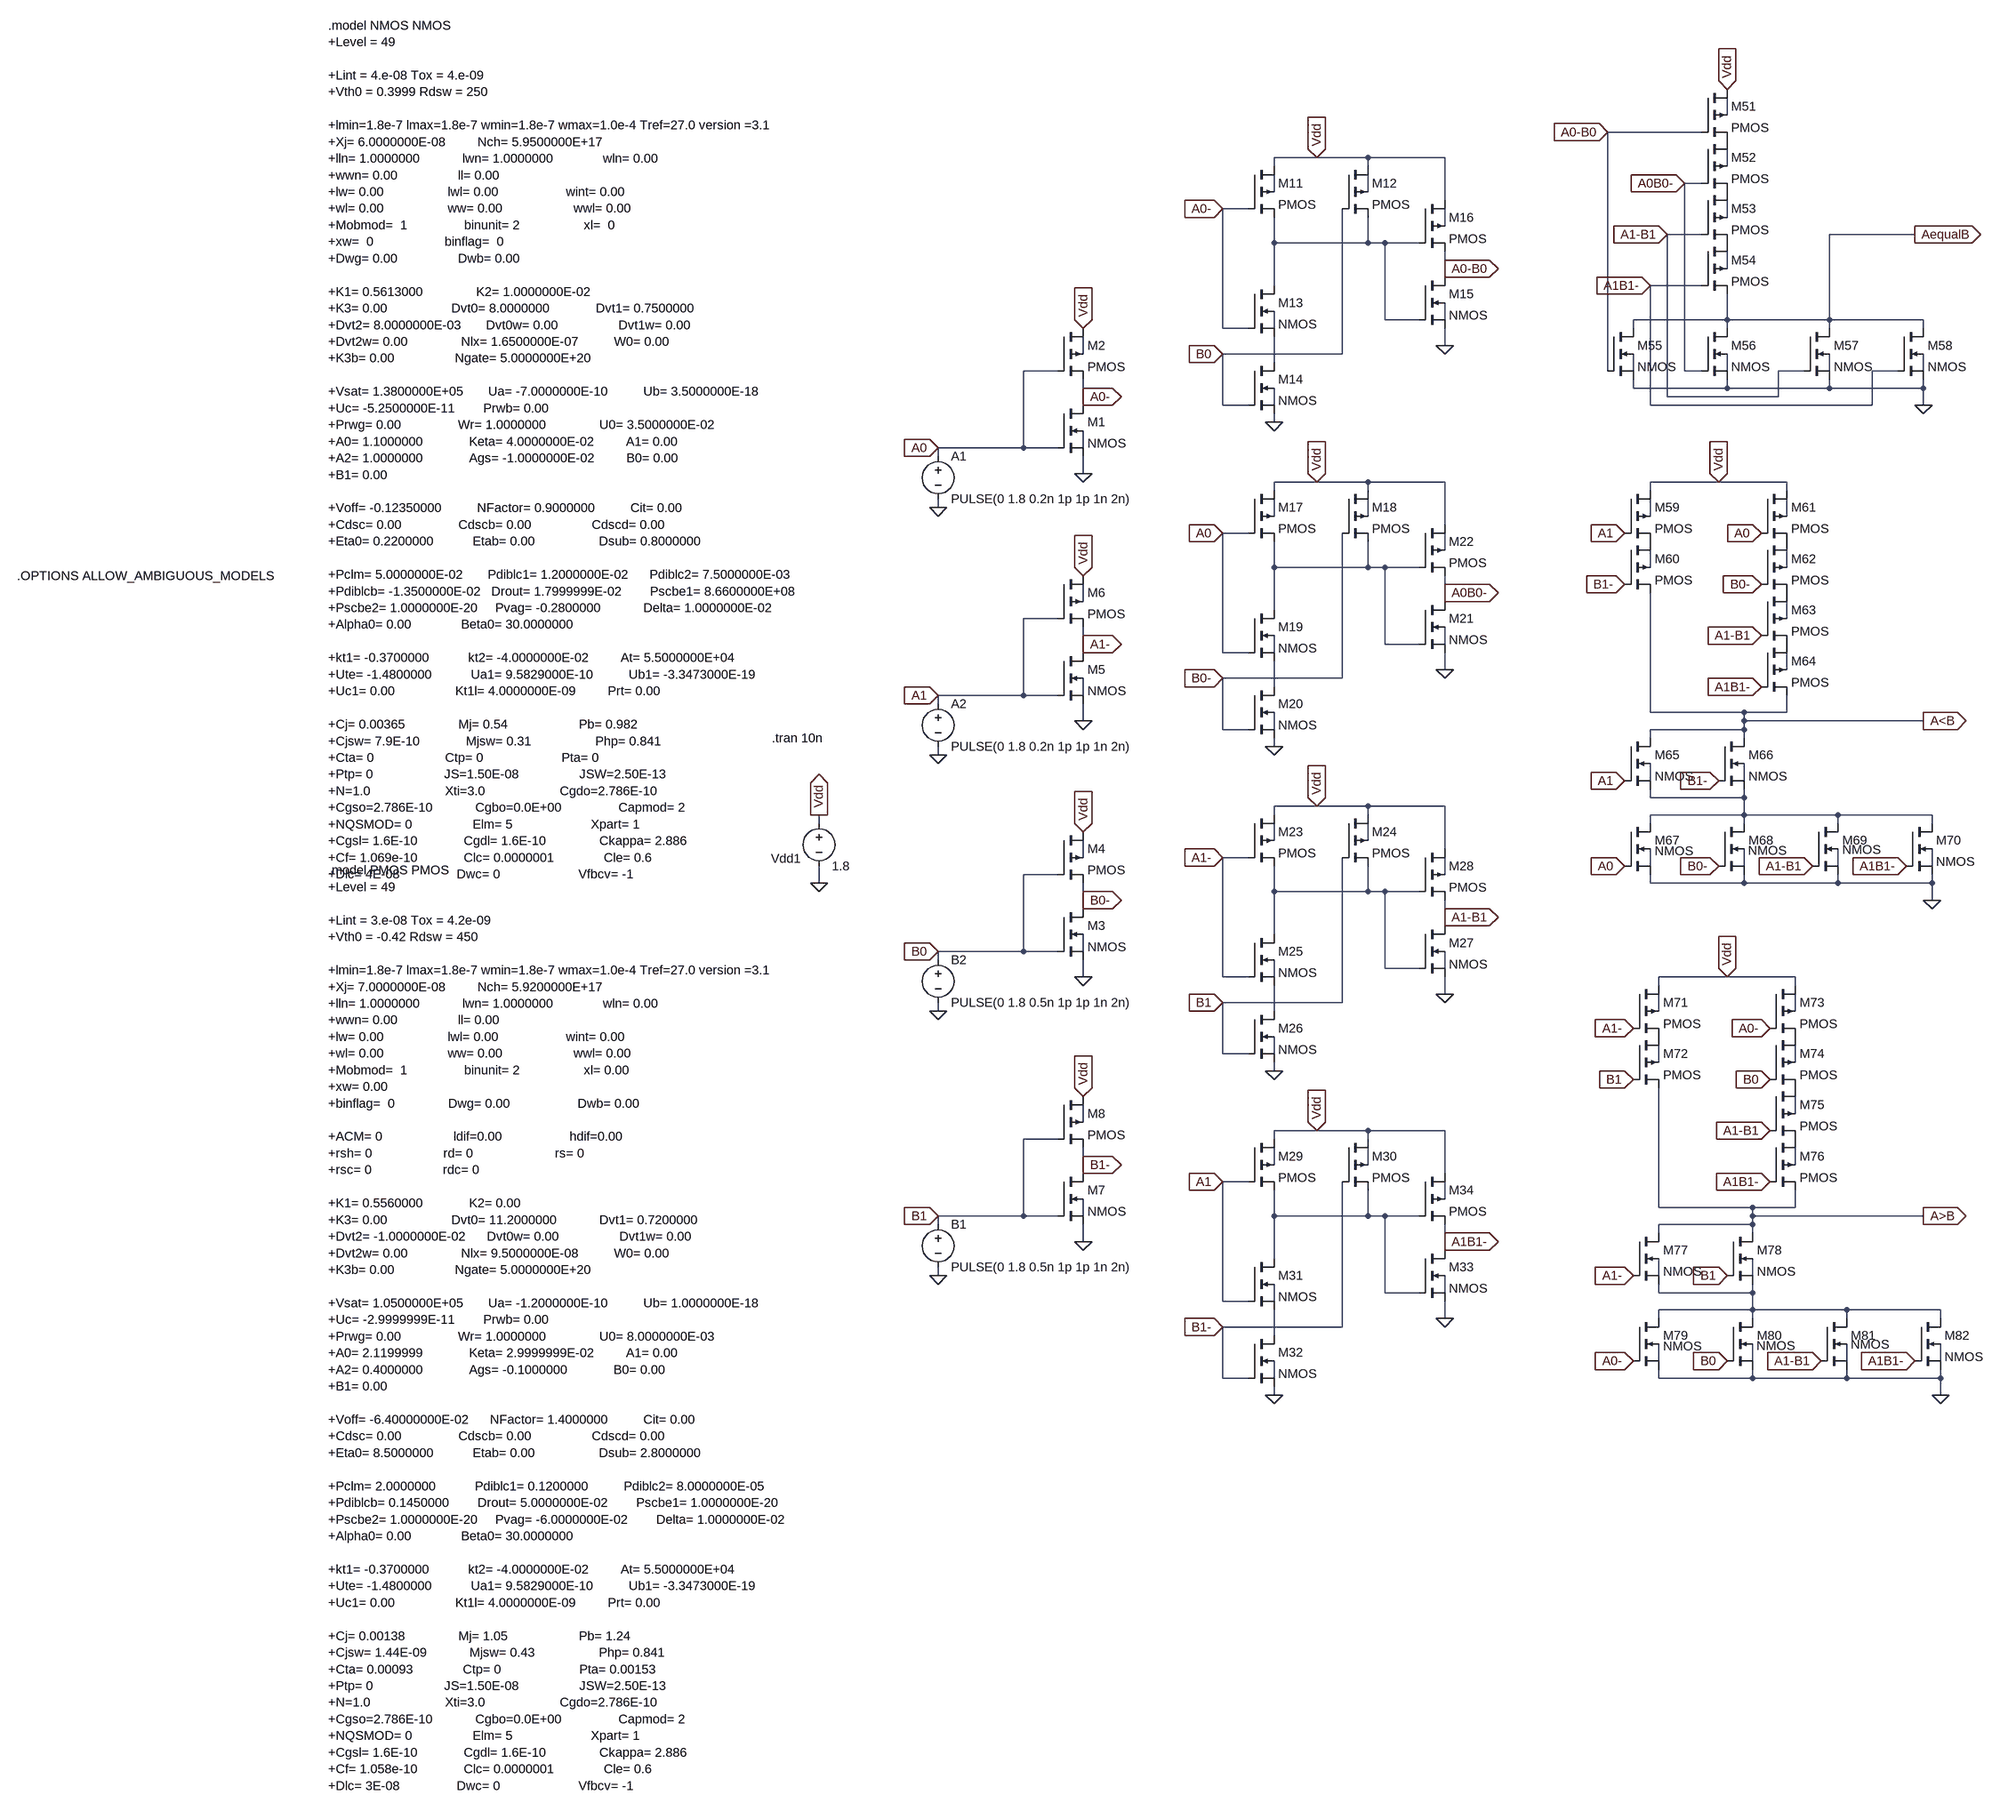
[diagram p0: schematic 2-bit-comparator-v1.asc]
2-bit-comparator-v1.asc, the LTspice schematic file:
Version 4.1
SHEET 1 2932 1852
WIRE 2000 -1456 2000 -1488
WIRE 1952 -1424 1776 -1424
WIRE 1104 -1376 1024 -1376
WIRE 1200 -1376 1104 -1376
WIRE 1344 -1376 1200 -1376
WIRE 1024 -1360 1024 -1376
WIRE 1200 -1360 1200 -1376
WIRE 2000 -1360 2000 -1392
WIRE 1952 -1328 1920 -1328
WIRE 1024 -1312 1024 -1344
WIRE 1200 -1312 1200 -1344
WIRE 1344 -1296 1344 -1376
WIRE 976 -1280 928 -1280
WIRE 2000 -1264 2000 -1296
WIRE 1344 -1248 1344 -1280
WIRE 1952 -1232 1888 -1232
WIRE 2352 -1232 2192 -1232
WIRE 1024 -1216 1024 -1264
WIRE 1200 -1216 1200 -1264
WIRE 1200 -1216 1024 -1216
WIRE 1232 -1216 1200 -1216
WIRE 1296 -1216 1232 -1216
WIRE 1344 -1168 1344 -1200
WIRE 2000 -1168 2000 -1200
WIRE 1344 -1152 1344 -1168
WIRE 1024 -1136 1024 -1216
WIRE 1952 -1136 1856 -1136
WIRE 1232 -1072 1232 -1216
WIRE 1296 -1072 1232 -1072
WIRE 1344 -1072 1344 -1104
WIRE 2000 -1072 2000 -1120
WIRE 2000 -1072 1824 -1072
WIRE 2192 -1072 2192 -1232
WIRE 2192 -1072 2000 -1072
WIRE 2368 -1072 2192 -1072
WIRE 928 -1056 928 -1280
WIRE 976 -1056 928 -1056
WIRE 1024 -1056 1024 -1088
WIRE 1824 -1056 1824 -1072
WIRE 2000 -1056 2000 -1072
WIRE 2192 -1056 2192 -1072
WIRE 2368 -1056 2368 -1072
WIRE 1344 -1024 1344 -1056
WIRE 528 -1008 528 -1040
WIRE 1152 -1008 1152 -1280
WIRE 1152 -1008 928 -1008
WIRE 1024 -992 1024 -1040
WIRE 480 -976 416 -976
WIRE 1776 -976 1776 -1424
WIRE 1824 -976 1824 -1008
WIRE 1920 -976 1920 -1328
WIRE 1952 -976 1920 -976
WIRE 2000 -976 2000 -1008
WIRE 2144 -976 2096 -976
WIRE 2192 -976 2192 -1008
WIRE 2320 -976 2272 -976
WIRE 2368 -976 2368 -1008
WIRE 1824 -944 1824 -960
WIRE 2000 -944 2000 -960
WIRE 2000 -944 1824 -944
WIRE 2192 -944 2192 -960
WIRE 2192 -944 2000 -944
WIRE 2368 -944 2368 -960
WIRE 2368 -944 2192 -944
WIRE 528 -928 528 -960
WIRE 1888 -928 1888 -1232
WIRE 2096 -928 2096 -976
WIRE 2096 -928 1888 -928
WIRE 528 -912 528 -928
WIRE 928 -912 928 -1008
WIRE 976 -912 928 -912
WIRE 1024 -912 1024 -944
WIRE 1856 -912 1856 -1136
WIRE 2272 -912 2272 -976
WIRE 2272 -912 1856 -912
WIRE 2368 -912 2368 -944
WIRE 1024 -880 1024 -896
WIRE 416 -832 416 -976
WIRE 416 -832 256 -832
WIRE 480 -832 416 -832
WIRE 528 -832 528 -864
WIRE 256 -816 256 -832
WIRE 528 -784 528 -816
WIRE 1104 -768 1024 -768
WIRE 1200 -768 1104 -768
WIRE 1344 -768 1200 -768
WIRE 1984 -768 1856 -768
WIRE 2112 -768 1984 -768
WIRE 1024 -752 1024 -768
WIRE 1200 -752 1200 -768
WIRE 1856 -752 1856 -768
WIRE 2112 -752 2112 -768
WIRE 256 -720 256 -736
WIRE 1024 -704 1024 -736
WIRE 1200 -704 1200 -736
WIRE 1856 -704 1856 -736
WIRE 2112 -704 2112 -736
WIRE 1344 -688 1344 -768
WIRE 976 -672 928 -672
WIRE 1344 -640 1344 -672
WIRE 1024 -608 1024 -656
WIRE 1200 -608 1200 -656
WIRE 1200 -608 1024 -608
WIRE 1232 -608 1200 -608
WIRE 1296 -608 1232 -608
WIRE 1856 -608 1856 -640
WIRE 2112 -608 2112 -640
WIRE 1344 -560 1344 -592
WIRE 528 -544 528 -576
WIRE 1344 -544 1344 -560
WIRE 1024 -528 1024 -608
WIRE 480 -512 416 -512
WIRE 2112 -512 2112 -544
WIRE 528 -464 528 -496
WIRE 1232 -464 1232 -608
WIRE 1296 -464 1232 -464
WIRE 1344 -464 1344 -496
WIRE 528 -448 528 -464
WIRE 928 -448 928 -672
WIRE 976 -448 928 -448
WIRE 1024 -448 1024 -480
WIRE 1344 -416 1344 -448
WIRE 2112 -416 2112 -448
WIRE 1152 -400 1152 -672
WIRE 1152 -400 928 -400
WIRE 1024 -384 1024 -432
WIRE 416 -368 416 -512
WIRE 416 -368 256 -368
WIRE 480 -368 416 -368
WIRE 528 -368 528 -400
WIRE 256 -352 256 -368
WIRE 1856 -336 1856 -560
WIRE 2032 -336 1856 -336
WIRE 2112 -336 2112 -368
WIRE 2112 -336 2032 -336
WIRE 528 -320 528 -352
WIRE 2032 -320 2032 -336
WIRE 2368 -320 2032 -320
WIRE 928 -304 928 -400
WIRE 976 -304 928 -304
WIRE 1024 -304 1024 -336
WIRE 2032 -304 2032 -320
WIRE 2032 -304 1856 -304
WIRE 1856 -288 1856 -304
WIRE 2032 -288 2032 -304
WIRE 1024 -272 1024 -288
WIRE 256 -256 256 -272
WIRE 1856 -208 1856 -240
WIRE 2032 -208 2032 -240
WIRE 1856 -176 1856 -192
WIRE 2032 -176 2032 -192
WIRE 2032 -176 1856 -176
WIRE 1104 -160 1024 -160
WIRE 1200 -160 1104 -160
WIRE 1344 -160 1200 -160
WIRE 1024 -144 1024 -160
WIRE 1200 -144 1200 -160
WIRE 2032 -144 2032 -176
WIRE 2032 -144 1856 -144
WIRE 2208 -144 2032 -144
WIRE 2384 -144 2208 -144
WIRE 16 -128 16 -144
WIRE 1856 -128 1856 -144
WIRE 2032 -128 2032 -144
WIRE 2208 -128 2208 -144
WIRE 2384 -128 2384 -144
WIRE 1024 -96 1024 -128
WIRE 1200 -96 1200 -128
WIRE 1344 -80 1344 -160
WIRE 528 -64 528 -96
WIRE 976 -64 928 -64
WIRE 1856 -48 1856 -80
WIRE 2032 -48 2032 -80
WIRE 2208 -48 2208 -80
WIRE 2384 -48 2384 -80
WIRE 480 -32 416 -32
WIRE 1344 -32 1344 -64
WIRE 16 -16 16 -48
WIRE 1856 -16 1856 -32
WIRE 2032 -16 2032 -32
WIRE 2032 -16 1856 -16
WIRE 2208 -16 2208 -32
WIRE 2208 -16 2032 -16
WIRE 2384 -16 2384 -32
WIRE 2384 -16 2208 -16
WIRE 1024 0 1024 -48
WIRE 1200 0 1200 -48
WIRE 1200 0 1024 0
WIRE 1232 0 1200 0
WIRE 1296 0 1232 0
WIRE 528 16 528 -16
WIRE 2384 16 2384 -16
WIRE 528 32 528 16
WIRE 1344 48 1344 16
WIRE 1344 64 1344 48
WIRE 1024 80 1024 0
WIRE 416 112 416 -32
WIRE 416 112 256 112
WIRE 480 112 416 112
WIRE 528 112 528 80
WIRE 256 128 256 112
WIRE 1232 144 1232 0
WIRE 1296 144 1232 144
WIRE 1344 144 1344 112
WIRE 528 160 528 128
WIRE 928 160 928 -64
WIRE 976 160 928 160
WIRE 1024 160 1024 128
WIRE 2000 160 1872 160
WIRE 2128 160 2000 160
WIRE 1872 176 1872 160
WIRE 2128 176 2128 160
WIRE 1344 192 1344 160
WIRE 1152 208 1152 -64
WIRE 1152 208 928 208
WIRE 256 224 256 208
WIRE 1024 224 1024 176
WIRE 1872 224 1872 192
WIRE 2128 224 2128 192
WIRE 928 304 928 208
WIRE 976 304 928 304
WIRE 1024 304 1024 272
WIRE 1872 320 1872 288
WIRE 2128 320 2128 288
WIRE 1024 336 1024 320
WIRE 2128 416 2128 384
WIRE 528 432 528 400
WIRE 1104 448 1024 448
WIRE 1200 448 1104 448
WIRE 1344 448 1200 448
WIRE 480 464 416 464
WIRE 1024 464 1024 448
WIRE 1200 464 1200 448
WIRE 528 512 528 480
WIRE 1024 512 1024 480
WIRE 1200 512 1200 480
WIRE 2128 512 2128 480
WIRE 528 528 528 512
WIRE 1344 528 1344 448
WIRE 976 544 928 544
WIRE 1344 576 1344 544
WIRE 1872 592 1872 368
WIRE 2048 592 1872 592
WIRE 2128 592 2128 560
WIRE 2128 592 2048 592
WIRE 416 608 416 464
WIRE 416 608 256 608
WIRE 480 608 416 608
WIRE 528 608 528 576
WIRE 1024 608 1024 560
WIRE 1200 608 1200 560
WIRE 1200 608 1024 608
WIRE 1232 608 1200 608
WIRE 1296 608 1232 608
WIRE 2048 608 2048 592
WIRE 2368 608 2048 608
WIRE 256 624 256 608
WIRE 2048 624 2048 608
WIRE 2048 624 1872 624
WIRE 1872 640 1872 624
WIRE 2048 640 2048 624
WIRE 528 656 528 624
WIRE 1344 656 1344 624
WIRE 1344 672 1344 656
WIRE 1024 688 1024 608
WIRE 256 720 256 704
WIRE 1872 720 1872 688
WIRE 2048 720 2048 688
WIRE 1232 752 1232 608
WIRE 1296 752 1232 752
WIRE 1344 752 1344 720
WIRE 1872 752 1872 736
WIRE 2048 752 2048 736
WIRE 2048 752 1872 752
WIRE 928 768 928 544
WIRE 976 768 928 768
WIRE 1024 768 1024 736
WIRE 2048 784 2048 752
WIRE 2048 784 1872 784
WIRE 2224 784 2048 784
WIRE 2400 784 2224 784
WIRE 1344 800 1344 768
WIRE 1872 800 1872 784
WIRE 2048 800 2048 784
WIRE 2224 800 2224 784
WIRE 2400 800 2400 784
WIRE 1152 816 1152 544
WIRE 1152 816 928 816
WIRE 1024 832 1024 784
WIRE 1872 880 1872 848
WIRE 2048 880 2048 848
WIRE 2224 880 2224 848
WIRE 2400 880 2400 848
WIRE 928 912 928 816
WIRE 976 912 928 912
WIRE 1024 912 1024 880
WIRE 1872 912 1872 896
WIRE 2048 912 2048 896
WIRE 2048 912 1872 912
WIRE 2224 912 2224 896
WIRE 2224 912 2048 912
WIRE 2400 912 2400 896
WIRE 2400 912 2224 912
WIRE 1024 944 1024 928
WIRE 2400 944 2400 912
FLAG 528 -784 0
FLAG 528 160 0
FLAG 528 -320 0
FLAG 528 656 0
FLAG 528 -1056 Vdd
IOPIN 528 -1056 In
FLAG 528 -592 Vdd
IOPIN 528 -592 In
FLAG 528 384 Vdd
IOPIN 528 384 In
FLAG 528 -112 Vdd
IOPIN 528 -112 In
FLAG 528 -928 A0-
IOPIN 528 -928 Out
FLAG 528 -464 A1-
IOPIN 528 -464 Out
FLAG 528 16 B0-
IOPIN 528 16 Out
FLAG 528 512 B1-
IOPIN 528 512 Out
FLAG 256 -720 0
FLAG 256 -256 0
FLAG 256 224 0
FLAG 256 720 0
FLAG 256 -832 A0
IOPIN 256 -832 In
FLAG 256 -368 A1
IOPIN 256 -368 In
FLAG 256 112 B0
IOPIN 256 112 In
FLAG 256 608 B1
IOPIN 256 608 In
FLAG 16 -16 0
FLAG 16 -144 Vdd
IOPIN 16 -144 Out
FLAG 1344 -1024 0
FLAG 1104 -1376 Vdd
IOPIN 1104 -1376 In
FLAG 1344 -1168 A0-B0
IOPIN 1344 -1168 Out
FLAG 1024 -880 0
FLAG 928 -1280 A0-
IOPIN 928 -1280 In
FLAG 928 -1008 B0
IOPIN 928 -1008 In
FLAG 1344 -416 0
FLAG 1104 -768 Vdd
IOPIN 1104 -768 In
FLAG 1344 -560 A0B0-
IOPIN 1344 -560 Out
FLAG 1024 -272 0
FLAG 1344 192 0
FLAG 1104 -160 Vdd
IOPIN 1104 -160 In
FLAG 1344 48 A1-B1
IOPIN 1344 48 Out
FLAG 1024 336 0
FLAG 1344 800 0
FLAG 1104 448 Vdd
IOPIN 1104 448 In
FLAG 1344 656 A1B1-
IOPIN 1344 656 Out
FLAG 1024 944 0
FLAG 2368 -912 0
FLAG 1776 -1424 A0-B0
IOPIN 1776 -1424 In
FLAG 1920 -1328 A0B0-
IOPIN 1920 -1328 In
FLAG 1888 -1232 A1-B1
IOPIN 1888 -1232 In
FLAG 1856 -1136 A1B1-
IOPIN 1856 -1136 In
FLAG 2000 -1504 Vdd
IOPIN 2000 -1504 In
FLAG 2352 -1232 AequalB
IOPIN 2352 -1232 Out
FLAG 928 -672 A0
IOPIN 928 -672 In
FLAG 928 -400 B0-
IOPIN 928 -400 In
FLAG 928 -64 A1-
IOPIN 928 -64 In
FLAG 928 208 B1
IOPIN 928 208 In
FLAG 928 544 A1
IOPIN 928 544 In
FLAG 928 816 B1-
IOPIN 928 816 In
FLAG 2368 -320 A<B
IOPIN 2368 -320 Out
FLAG 2384 16 0
FLAG 1984 -768 Vdd
IOPIN 1984 -768 In
FLAG 2064 -576 B0-
IOPIN 2064 -576 In
FLAG 1984 -48 B0-
IOPIN 1984 -48 In
FLAG 2064 -672 A0
IOPIN 2064 -672 In
FLAG 1808 -48 A0
IOPIN 1808 -48 In
FLAG 2064 -480 A1-B1
IOPIN 2064 -480 In
FLAG 2160 -48 A1-B1
IOPIN 2160 -48 In
FLAG 2336 -48 A1B1-
IOPIN 2336 -48 In
FLAG 2064 -384 A1B1-
IOPIN 2064 -384 In
FLAG 1808 -208 A1
IOPIN 1808 -208 In
FLAG 1984 -208 B1-
IOPIN 1984 -208 In
FLAG 1808 -672 A1
IOPIN 1808 -672 In
FLAG 1808 -576 B1-
IOPIN 1808 -576 In
FLAG 2368 608 A>B
IOPIN 2368 608 Out
FLAG 2400 944 0
FLAG 2000 160 Vdd
IOPIN 2000 160 In
FLAG 2080 448 A1-B1
IOPIN 2080 448 In
FLAG 2176 880 A1-B1
IOPIN 2176 880 In
FLAG 2352 880 A1B1-
IOPIN 2352 880 In
FLAG 2080 544 A1B1-
IOPIN 2080 544 In
FLAG 1824 256 A1-
IOPIN 1824 256 In
FLAG 1824 720 A1-
IOPIN 1824 720 In
FLAG 1824 352 B1
IOPIN 1824 352 In
FLAG 2000 720 B1
IOPIN 2000 720 In
FLAG 2080 256 A0-
IOPIN 2080 256 In
FLAG 2080 352 B0
IOPIN 2080 352 In
FLAG 1824 880 A0-
IOPIN 1824 880 In
FLAG 2000 880 B0
IOPIN 2000 880 In
SYMBOL nmos4 480 -912 R0
SYMATTR InstName M1
SYMATTR Value2 l=180n w=400n
SYMBOL pmos4 480 -1056 R0
SYMATTR InstName M2
SYMATTR Value2 l=180n w=400n
SYMBOL nmos4 480 32 R0
SYMATTR InstName M3
SYMATTR Value2 l=180n w=400n
SYMBOL pmos4 480 -112 R0
SYMATTR InstName M4
SYMATTR Value2 l=180n w=400n
SYMBOL nmos4 480 -448 R0
SYMATTR InstName M5
SYMATTR Value2 l=180n w=400n
SYMBOL pmos4 480 -592 R0
SYMATTR InstName M6
SYMATTR Value2 l=180n w=400n
SYMBOL nmos4 480 528 R0
SYMATTR InstName M7
SYMATTR Value2 l=180n w=400n
SYMBOL pmos4 480 384 R0
SYMATTR InstName M8
SYMATTR Value2 l=180n w=400n
SYMBOL voltage 256 -832 R0
WINDOW 123 0 0 Left 0
WINDOW 39 0 0 Left 0
SYMATTR InstName A1
SYMATTR Value PULSE(0 1.8 0.2n 1p 1p 1n 2n)
SYMBOL voltage 256 -368 R0
WINDOW 123 0 0 Left 0
WINDOW 39 0 0 Left 0
SYMATTR InstName A2
SYMATTR Value PULSE(0 1.8 0.2n 1p 1p 1n 2n)
SYMBOL voltage 256 608 R0
WINDOW 123 0 0 Left 0
WINDOW 39 0 0 Left 0
SYMATTR InstName B1
SYMATTR Value PULSE(0 1.8 0.5n 1p 1p 1n 2n)
SYMBOL voltage 256 112 R0
WINDOW 123 0 0 Left 0
WINDOW 39 0 0 Left 0
SYMATTR InstName B2
SYMATTR Value PULSE(0 1.8 0.5n 1p 1p 1n 2n)
SYMBOL voltage 16 -144 R0
WINDOW 0 -90 82 Left 2
SYMATTR InstName Vdd1
SYMATTR Value 1.8
SYMBOL pmos4 976 -1360 R0
SYMATTR InstName M11
SYMATTR Value2 l=180n w=400n
SYMBOL pmos4 1152 -1360 R0
SYMATTR InstName M12
SYMATTR Value2 l=180n w=400n
SYMBOL nmos4 976 -1136 R0
SYMATTR InstName M13
SYMATTR Value2 l=180n w=400n
SYMBOL nmos4 976 -992 R0
SYMATTR InstName M14
SYMATTR Value2 l=180n w=400n
SYMBOL nmos4 1296 -1152 R0
SYMATTR InstName M15
SYMATTR Value2 l=180n w=400n
SYMBOL pmos4 1296 -1296 R0
SYMATTR InstName M16
SYMATTR Value2 l=180n w=400n
SYMBOL pmos4 976 -752 R0
SYMATTR InstName M17
SYMATTR Value2 l=180n w=400n
SYMBOL pmos4 1152 -752 R0
SYMATTR InstName M18
SYMATTR Value2 l=180n w=400n
SYMBOL nmos4 976 -528 R0
SYMATTR InstName M19
SYMATTR Value2 l=180n w=400n
SYMBOL nmos4 976 -384 R0
SYMATTR InstName M20
SYMATTR Value2 l=180n w=400n
SYMBOL nmos4 1296 -544 R0
SYMATTR InstName M21
SYMATTR Value2 l=180n w=400n
SYMBOL pmos4 1296 -688 R0
SYMATTR InstName M22
SYMATTR Value2 l=180n w=400n
SYMBOL pmos4 976 -144 R0
SYMATTR InstName M23
SYMATTR Value2 l=180n w=400n
SYMBOL pmos4 1152 -144 R0
SYMATTR InstName M24
SYMATTR Value2 l=180n w=400n
SYMBOL nmos4 976 80 R0
SYMATTR InstName M25
SYMATTR Value2 l=180n w=400n
SYMBOL nmos4 976 224 R0
SYMATTR InstName M26
SYMATTR Value2 l=180n w=400n
SYMBOL nmos4 1296 64 R0
SYMATTR InstName M27
SYMATTR Value2 l=180n w=400n
SYMBOL pmos4 1296 -80 R0
SYMATTR InstName M28
SYMATTR Value2 l=180n w=400n
SYMBOL pmos4 976 464 R0
SYMATTR InstName M29
SYMATTR Value2 l=180n w=400n
SYMBOL pmos4 1152 464 R0
SYMATTR InstName M30
SYMATTR Value2 l=180n w=400n
SYMBOL nmos4 976 688 R0
SYMATTR InstName M31
SYMATTR Value2 l=180n w=400n
SYMBOL nmos4 976 832 R0
SYMATTR InstName M32
SYMATTR Value2 l=180n w=400n
SYMBOL nmos4 1296 672 R0
SYMATTR InstName M33
SYMATTR Value2 l=180n w=400n
SYMBOL pmos4 1296 528 R0
SYMATTR InstName M34
SYMATTR Value2 l=180n w=400n
SYMBOL pmos4 1952 -1504 R0
SYMATTR InstName M51
SYMATTR Value2 l=180n w=400n
SYMBOL pmos4 1952 -1408 R0
SYMATTR InstName M52
SYMATTR Value2 l=180n w=400n
SYMBOL pmos4 1952 -1312 R0
SYMATTR InstName M53
SYMATTR Value2 l=180n w=400n
SYMBOL pmos4 1952 -1216 R0
SYMATTR InstName M54
SYMATTR Value2 l=180n w=400n
SYMBOL nmos4 1776 -1056 R0
SYMATTR InstName M55
SYMATTR Value2 l=180n w=400n
SYMBOL nmos4 1952 -1056 R0
SYMATTR InstName M56
SYMATTR Value2 l=180n w=400n
SYMBOL nmos4 2144 -1056 R0
SYMATTR InstName M57
SYMATTR Value2 l=180n w=400n
SYMBOL nmos4 2320 -1056 R0
SYMATTR InstName M58
SYMATTR Value2 l=180n w=400n
SYMBOL pmos4 1808 -752 R0
SYMATTR InstName M59
SYMATTR Value2 l=180n w=400n
SYMBOL pmos4 1808 -656 R0
SYMATTR InstName M60
SYMATTR Value2 l=180n w=400n
SYMBOL pmos4 2064 -752 R0
SYMATTR InstName M61
SYMATTR Value2 l=180n w=400n
SYMBOL pmos4 2064 -656 R0
SYMATTR InstName M62
SYMATTR Value2 l=180n w=400n
SYMBOL pmos4 2064 -560 R0
SYMATTR InstName M63
SYMATTR Value2 l=180n w=400n
SYMBOL pmos4 2064 -464 R0
SYMATTR InstName M64
SYMATTR Value2 l=180n w=400n
SYMBOL nmos4 1808 -288 R0
SYMATTR InstName M65
SYMATTR Value2 l=180n w=400n
SYMBOL nmos4 1984 -288 R0
SYMATTR InstName M66
SYMATTR Value2 l=180n w=400n
SYMBOL nmos4 1808 -128 R0
WINDOW 3 56 52 Left 2
SYMATTR InstName M67
SYMATTR Value2 l=180n w=400n
SYMBOL nmos4 1984 -128 R0
WINDOW 3 55 51 Left 2
SYMATTR InstName M68
SYMATTR Value2 l=180n w=400n
SYMBOL nmos4 2160 -128 R0
WINDOW 3 56 49 Left 2
SYMATTR InstName M69
SYMATTR Value2 l=180n w=400n
SYMBOL nmos4 2336 -128 R0
SYMATTR InstName M70
SYMATTR Value2 l=180n w=400n
SYMBOL pmos4 1824 176 R0
SYMATTR InstName M71
SYMATTR Value2 l=180n w=400n
SYMBOL pmos4 1824 272 R0
SYMATTR InstName M72
SYMATTR Value2 l=180n w=400n
SYMBOL pmos4 2080 176 R0
SYMATTR InstName M73
SYMATTR Value2 l=180n w=400n
SYMBOL pmos4 2080 272 R0
SYMATTR InstName M74
SYMATTR Value2 l=180n w=400n
SYMBOL pmos4 2080 368 R0
SYMATTR InstName M75
SYMATTR Value2 l=180n w=400n
SYMBOL pmos4 2080 464 R0
SYMATTR InstName M76
SYMATTR Value2 l=180n w=400n
SYMBOL nmos4 1824 640 R0
SYMATTR InstName M77
SYMATTR Value2 l=180n w=400n
SYMBOL nmos4 2000 640 R0
SYMATTR InstName M78
SYMATTR Value2 l=180n w=400n
SYMBOL nmos4 1824 800 R0
WINDOW 3 56 52 Left 2
SYMATTR InstName M79
SYMATTR Value2 l=180n w=400n
SYMBOL nmos4 2000 800 R0
WINDOW 3 55 51 Left 2
SYMATTR InstName M80
SYMATTR Value2 l=180n w=400n
SYMBOL nmos4 2176 800 R0
WINDOW 3 56 49 Left 2
SYMATTR InstName M81
SYMATTR Value2 l=180n w=400n
SYMBOL nmos4 2352 800 R0
SYMATTR InstName M82
SYMATTR Value2 l=180n w=400n
TEXT -72 -288 Left 2 !.tran 10n
TEXT -904 -1624 Left 2 !.model NMOS NMOS\n+Level = 49\n \n+Lint = 4.e-08 Tox = 4.e-09 \n+Vth0 = 0.3999 Rdsw = 250 \n \n+lmin=1.8e-7 lmax=1.8e-7 wmin=1.8e-7 wmax=1.0e-4 Tref=27.0 version =3.1\n+Xj= 6.0000000E-08         Nch= 5.9500000E+17 \n+lln= 1.0000000            lwn= 1.0000000              wln= 0.00\n+wwn= 0.00                 ll= 0.00\n+lw= 0.00                  lwl= 0.00                   wint= 0.00\n+wl= 0.00                  ww= 0.00                    wwl= 0.00\n+Mobmod=  1                binunit= 2                  xl=  0\n+xw=  0                    binflag=  0\n+Dwg= 0.00                 Dwb= 0.00 \n \n+K1= 0.5613000               K2= 1.0000000E-02 \n+K3= 0.00                  Dvt0= 8.0000000             Dvt1= 0.7500000 \n+Dvt2= 8.0000000E-03       Dvt0w= 0.00                 Dvt1w= 0.00 \n+Dvt2w= 0.00               Nlx= 1.6500000E-07          W0= 0.00 \n+K3b= 0.00                 Ngate= 5.0000000E+20 \n \n+Vsat= 1.3800000E+05       Ua= -7.0000000E-10          Ub= 3.5000000E-18 \n+Uc= -5.2500000E-11        Prwb= 0.00 \n+Prwg= 0.00                Wr= 1.0000000               U0= 3.5000000E-02 \n+A0= 1.1000000             Keta= 4.0000000E-02         A1= 0.00 \n+A2= 1.0000000             Ags= -1.0000000E-02         B0= 0.00 \n+B1= 0.00 \n \n+Voff= -0.12350000          NFactor= 0.9000000          Cit= 0.00 \n+Cdsc= 0.00                Cdscb= 0.00                 Cdscd= 0.00 \n+Eta0= 0.2200000           Etab= 0.00                  Dsub= 0.8000000 \n \n+Pclm= 5.0000000E-02       Pdiblc1= 1.2000000E-02      Pdiblc2= 7.5000000E-03 \n+Pdiblcb= -1.3500000E-02   Drout= 1.7999999E-02        Pscbe1= 8.6600000E+08 \n+Pscbe2= 1.0000000E-20     Pvag= -0.2800000            Delta= 1.0000000E-02 \n+Alpha0= 0.00              Beta0= 30.0000000 \n \n+kt1= -0.3700000           kt2= -4.0000000E-02         At= 5.5000000E+04 \n+Ute= -1.4800000           Ua1= 9.5829000E-10          Ub1= -3.3473000E-19 \n+Uc1= 0.00                 Kt1l= 4.0000000E-09         Prt= 0.00 \n \n+Cj= 0.00365               Mj= 0.54                    Pb= 0.982\n+Cjsw= 7.9E-10             Mjsw= 0.31                  Php= 0.841\n+Cta= 0                    Ctp= 0                      Pta= 0\n+Ptp= 0                    JS=1.50E-08                 JSW=2.50E-13\n+N=1.0                     Xti=3.0                     Cgdo=2.786E-10\n+Cgso=2.786E-10            Cgbo=0.0E+00                Capmod= 2\n+NQSMOD= 0                 Elm= 5                      Xpart= 1\n+Cgsl= 1.6E-10             Cgdl= 1.6E-10               Ckappa= 2.886\n+Cf= 1.069e-10             Clc= 0.0000001              Cle= 0.6\n+Dlc= 4E-08                Dwc= 0                      Vfbcv= -1
TEXT -904 -40 Left 2 !.model PMOS PMOS\n+Level = 49\n \n+Lint = 3.e-08 Tox = 4.2e-09 \n+Vth0 = -0.42 Rdsw = 450 \n \n+lmin=1.8e-7 lmax=1.8e-7 wmin=1.8e-7 wmax=1.0e-4 Tref=27.0 version =3.1\n+Xj= 7.0000000E-08         Nch= 5.9200000E+17 \n+lln= 1.0000000            lwn= 1.0000000              wln= 0.00\n+wwn= 0.00                 ll= 0.00\n+lw= 0.00                  lwl= 0.00                   wint= 0.00\n+wl= 0.00                  ww= 0.00                    wwl= 0.00\n+Mobmod=  1                binunit= 2                  xl= 0.00\n+xw= 0.00                  \n+binflag=  0               Dwg= 0.00                   Dwb= 0.00 \n \n+ACM= 0                    ldif=0.00                   hdif=0.00\n+rsh= 0                    rd= 0                       rs= 0\n+rsc= 0                    rdc= 0\n \n+K1= 0.5560000             K2= 0.00 \n+K3= 0.00                  Dvt0= 11.2000000            Dvt1= 0.7200000 \n+Dvt2= -1.0000000E-02      Dvt0w= 0.00                 Dvt1w= 0.00 \n+Dvt2w= 0.00               Nlx= 9.5000000E-08          W0= 0.00 \n+K3b= 0.00                 Ngate= 5.0000000E+20 \n \n+Vsat= 1.0500000E+05       Ua= -1.2000000E-10          Ub= 1.0000000E-18 \n+Uc= -2.9999999E-11        Prwb= 0.00 \n+Prwg= 0.00                Wr= 1.0000000               U0= 8.0000000E-03 \n+A0= 2.1199999             Keta= 2.9999999E-02         A1= 0.00 \n+A2= 0.4000000             Ags= -0.1000000             B0= 0.00 \n+B1= 0.00 \n \n+Voff= -6.40000000E-02      NFactor= 1.4000000          Cit= 0.00 \n+Cdsc= 0.00                Cdscb= 0.00                 Cdscd= 0.00 \n+Eta0= 8.5000000           Etab= 0.00                  Dsub= 2.8000000 \n \n+Pclm= 2.0000000           Pdiblc1= 0.1200000          Pdiblc2= 8.0000000E-05 \n+Pdiblcb= 0.1450000        Drout= 5.0000000E-02        Pscbe1= 1.0000000E-20 \n+Pscbe2= 1.0000000E-20     Pvag= -6.0000000E-02        Delta= 1.0000000E-02 \n+Alpha0= 0.00              Beta0= 30.0000000 \n \n+kt1= -0.3700000           kt2= -4.0000000E-02         At= 5.5000000E+04 \n+Ute= -1.4800000           Ua1= 9.5829000E-10          Ub1= -3.3473000E-19 \n+Uc1= 0.00                 Kt1l= 4.0000000E-09         Prt= 0.00 \n \n+Cj= 0.00138               Mj= 1.05                    Pb= 1.24\n+Cjsw= 1.44E-09            Mjsw= 0.43                  Php= 0.841\n+Cta= 0.00093              Ctp= 0                      Pta= 0.00153\n+Ptp= 0                    JS=1.50E-08                 JSW=2.50E-13\n+N=1.0                     Xti=3.0                     Cgdo=2.786E-10\n+Cgso=2.786E-10            Cgbo=0.0E+00                Capmod= 2\n+NQSMOD= 0                 Elm= 5                      Xpart= 1\n+Cgsl= 1.6E-10             Cgdl= 1.6E-10               Ckappa= 2.886\n+Cf= 1.058e-10             Clc= 0.0000001              Cle= 0.6\n+Dlc= 3E-08                Dwc= 0                      Vfbcv= -1
TEXT -1504 -592 Left 2 !.OPTIONS ALLOW_AMBIGUOUS_MODELS

The netlist it stands for:
* 2-bit-comparator-v1.asc
M1 A0- A0 0 N018 NMOS l=180n w=400n
M2 Vdd A0 A0- N011 PMOS l=180n w=400n
M3 B0- B0 0 N047 NMOS l=180n w=400n
M4 Vdd B0 B0- N040 PMOS l=180n w=400n
M5 A1- A1 0 N033 NMOS l=180n w=400n
M6 Vdd A1 A1- N027 PMOS l=180n w=400n
M7 B1- B1 0 N062 NMOS l=180n w=400n
M8 Vdd B1 B1- N057 PMOS l=180n w=400n
V§A1 A0 0 PULSE(0 1.8 0.2n 1p 1p 1n 2n)
V§A2 A1 0 PULSE(0 1.8 0.2n 1p 1p 1n 2n)
V§B1 B1 0 PULSE(0 1.8 0.5n 1p 1p 1n 2n)
V§B2 B0 0 PULSE(0 1.8 0.5n 1p 1p 1n 2n)
Vdd1 Vdd 0 1.8
M11 Vdd A0- N007 N003 PMOS l=180n w=400n
M12 Vdd B0 N007 N004 PMOS l=180n w=400n
M13 N007 A0- N012 N010 NMOS l=180n w=400n
M14 N012 B0 0 N017 NMOS l=180n w=400n
M15 A0-B0 N007 0 N009 NMOS l=180n w=400n
M16 Vdd N007 A0-B0 N006 PMOS l=180n w=400n
M17 Vdd A0 N024 N019 PMOS l=180n w=400n
M18 Vdd B0- N024 N020 PMOS l=180n w=400n
M19 N024 A0 N032 N030 NMOS l=180n w=400n
M20 N032 B0- 0 N034 NMOS l=180n w=400n
M21 A0B0- N024 0 N029 NMOS l=180n w=400n
M22 Vdd N024 A0B0- N023 PMOS l=180n w=400n
M23 Vdd A1- N046 N038 PMOS l=180n w=400n
M24 Vdd B1 N046 N039 PMOS l=180n w=400n
M25 N046 A1- N050 N049 NMOS l=180n w=400n
M26 N050 B1 0 N053 NMOS l=180n w=400n
M27 A1-B1 N046 0 N048 NMOS l=180n w=400n
M28 Vdd N046 A1-B1 N045 PMOS l=180n w=400n
M29 Vdd A1 N063 N058 PMOS l=180n w=400n
M30 Vdd B1- N063 N059 PMOS l=180n w=400n
M31 N063 A1 N069 N068 NMOS l=180n w=400n
M32 N069 B1- 0 N074 NMOS l=180n w=400n
M33 A1B1- N063 0 N066 NMOS l=180n w=400n
M34 Vdd N063 A1B1- N061 PMOS l=180n w=400n
M51 Vdd A0-B0 P001 N001 PMOS l=180n w=400n
M52 P001 A0B0- P002 N002 PMOS l=180n w=400n
M53 P002 A1-B1 P003 N005 PMOS l=180n w=400n
M54 P003 A1B1- AequalB N008 PMOS l=180n w=400n
M55 AequalB A0-B0 0 N013 NMOS l=180n w=400n
M56 AequalB A0B0- 0 N014 NMOS l=180n w=400n
M57 AequalB A1-B1 0 N015 NMOS l=180n w=400n
M58 AequalB A1B1- 0 N016 NMOS l=180n w=400n
M59 Vdd A1 P004 N021 PMOS l=180n w=400n
M60 P004 B1- A<B N025 PMOS l=180n w=400n
M61 Vdd A0 P005 N022 PMOS l=180n w=400n
M62 P005 B0- P006 N026 PMOS l=180n w=400n
M63 P006 A1-B1 P007 N028 PMOS l=180n w=400n
M64 P007 A1B1- A<B N031 PMOS l=180n w=400n
M65 A<B A1 N037 N035 NMOS l=180n w=400n
M66 A<B B1- N037 N036 NMOS l=180n w=400n
M67 N037 A0 0 N041 NMOS l=180n w=400n
M68 N037 B0- 0 N042 NMOS l=180n w=400n
M69 N037 A1-B1 0 N043 NMOS l=180n w=400n
M70 N037 A1B1- 0 N044 NMOS l=180n w=400n
M71 Vdd A1- P008 N051 PMOS l=180n w=400n
M72 P008 B1 A>B N054 PMOS l=180n w=400n
M73 Vdd A0- P009 N052 PMOS l=180n w=400n
M74 P009 B0 P010 N055 PMOS l=180n w=400n
M75 P010 A1-B1 P011 N056 PMOS l=180n w=400n
M76 P011 A1B1- A>B N060 PMOS l=180n w=400n
M77 A>B A1- N067 N064 NMOS l=180n w=400n
M78 A>B B1 N067 N065 NMOS l=180n w=400n
M79 N067 A0- 0 N070 NMOS l=180n w=400n
M80 N067 B0 0 N071 NMOS l=180n w=400n
M81 N067 A1-B1 0 N072 NMOS l=180n w=400n
M82 N067 A1B1- 0 N073 NMOS l=180n w=400n
.model NMOS NMOS
.model PMOS PMOS
.lib standard.mos
.tran 10n
.model NMOS NMOS
+Level = 49
+Lint = 4.e-08 Tox = 4.e-09
+Vth0 = 0.3999 Rdsw = 250
+lmin=1.8e-7 lmax=1.8e-7 wmin=1.8e-7 wmax=1.0e-4 Tref=27.0 version =3.1
+Xj= 6.0000000E-08         Nch= 5.9500000E+17
+lln= 1.0000000            lwn= 1.0000000              wln= 0.00
+wwn= 0.00                 ll= 0.00
+lw= 0.00                  lwl= 0.00                   wint= 0.00
+wl= 0.00                  ww= 0.00                    wwl= 0.00
+Mobmod=  1                binunit= 2                  xl=  0
+xw=  0                    binflag=  0
+Dwg= 0.00                 Dwb= 0.00
+K1= 0.5613000               K2= 1.0000000E-02
+K3= 0.00                  Dvt0= 8.0000000             Dvt1= 0.7500000
+Dvt2= 8.0000000E-03       Dvt0w= 0.00                 Dvt1w= 0.00
+Dvt2w= 0.00               Nlx= 1.6500000E-07          W0= 0.00
+K3b= 0.00                 Ngate= 5.0000000E+20
+Vsat= 1.3800000E+05       Ua= -7.0000000E-10          Ub= 3.5000000E-18
+Uc= -5.2500000E-11        Prwb= 0.00
+Prwg= 0.00                Wr= 1.0000000               U0= 3.5000000E-02
+A0= 1.1000000             Keta= 4.0000000E-02         A1= 0.00
+A2= 1.0000000             Ags= -1.0000000E-02         B0= 0.00
+B1= 0.00
+Voff= -0.12350000          NFactor= 0.9000000          Cit= 0.00
+Cdsc= 0.00                Cdscb= 0.00                 Cdscd= 0.00
+Eta0= 0.2200000           Etab= 0.00                  Dsub= 0.8000000
+Pclm= 5.0000000E-02       Pdiblc1= 1.2000000E-02      Pdiblc2= 7.5000000E-03
+Pdiblcb= -1.3500000E-02   Drout= 1.7999999E-02        Pscbe1= 8.6600000E+08
+Pscbe2= 1.0000000E-20     Pvag= -0.2800000            Delta= 1.0000000E-02
+Alpha0= 0.00              Beta0= 30.0000000
+kt1= -0.3700000           kt2= -4.0000000E-02         At= 5.5000000E+04
+Ute= -1.4800000           Ua1= 9.5829000E-10          Ub1= -3.3473000E-19
+Uc1= 0.00                 Kt1l= 4.0000000E-09         Prt= 0.00
+Cj= 0.00365               Mj= 0.54                    Pb= 0.982
+Cjsw= 7.9E-10             Mjsw= 0.31                  Php= 0.841
+Cta= 0                    Ctp= 0                      Pta= 0
+Ptp= 0                    JS=1.50E-08                 JSW=2.50E-13
+N=1.0                     Xti=3.0                     Cgdo=2.786E-10
+Cgso=2.786E-10            Cgbo=0.0E+00                Capmod= 2
+NQSMOD= 0                 Elm= 5                      Xpart= 1
+Cgsl= 1.6E-10             Cgdl= 1.6E-10               Ckappa= 2.886
+Cf= 1.069e-10             Clc= 0.0000001              Cle= 0.6
+Dlc= 4E-08                Dwc= 0                      Vfbcv= -1
.model PMOS PMOS
+Level = 49
+Lint = 3.e-08 Tox = 4.2e-09
+Vth0 = -0.42 Rdsw = 450
+lmin=1.8e-7 lmax=1.8e-7 wmin=1.8e-7 wmax=1.0e-4 Tref=27.0 version =3.1
+Xj= 7.0000000E-08         Nch= 5.9200000E+17
+lln= 1.0000000            lwn= 1.0000000              wln= 0.00
+wwn= 0.00                 ll= 0.00
+lw= 0.00                  lwl= 0.00                   wint= 0.00
+wl= 0.00                  ww= 0.00                    wwl= 0.00
+Mobmod=  1                binunit= 2                  xl= 0.00
+xw= 0.00
+binflag=  0               Dwg= 0.00                   Dwb= 0.00
+ACM= 0                    ldif=0.00                   hdif=0.00
+rsh= 0                    rd= 0                       rs= 0
+rsc= 0                    rdc= 0
+K1= 0.5560000             K2= 0.00
+K3= 0.00                  Dvt0= 11.2000000            Dvt1= 0.7200000
+Dvt2= -1.0000000E-02      Dvt0w= 0.00                 Dvt1w= 0.00
+Dvt2w= 0.00               Nlx= 9.5000000E-08          W0= 0.00
+K3b= 0.00                 Ngate= 5.0000000E+20
+Vsat= 1.0500000E+05       Ua= -1.2000000E-10          Ub= 1.0000000E-18
+Uc= -2.9999999E-11        Prwb= 0.00
+Prwg= 0.00                Wr= 1.0000000               U0= 8.0000000E-03
+A0= 2.1199999             Keta= 2.9999999E-02         A1= 0.00
+A2= 0.4000000             Ags= -0.1000000             B0= 0.00
+B1= 0.00
+Voff= -6.40000000E-02      NFactor= 1.4000000          Cit= 0.00
+Cdsc= 0.00                Cdscb= 0.00                 Cdscd= 0.00
+Eta0= 8.5000000           Etab= 0.00                  Dsub= 2.8000000
+Pclm= 2.0000000           Pdiblc1= 0.1200000          Pdiblc2= 8.0000000E-05
+Pdiblcb= 0.1450000        Drout= 5.0000000E-02        Pscbe1= 1.0000000E-20
+Pscbe2= 1.0000000E-20     Pvag= -6.0000000E-02        Delta= 1.0000000E-02
+Alpha0= 0.00              Beta0= 30.0000000
+kt1= -0.3700000           kt2= -4.0000000E-02         At= 5.5000000E+04
+Ute= -1.4800000           Ua1= 9.5829000E-10          Ub1= -3.3473000E-19
+Uc1= 0.00                 Kt1l= 4.0000000E-09         Prt= 0.00
+Cj= 0.00138               Mj= 1.05                    Pb= 1.24
+Cjsw= 1.44E-09            Mjsw= 0.43                  Php= 0.841
+Cta= 0.00093              Ctp= 0                      Pta= 0.00153
+Ptp= 0                    JS=1.50E-08                 JSW=2.50E-13
+N=1.0                     Xti=3.0                     Cgdo=2.786E-10
+Cgso=2.786E-10            Cgbo=0.0E+00                Capmod= 2
+NQSMOD= 0                 Elm= 5                      Xpart= 1
+Cgsl= 1.6E-10             Cgdl= 1.6E-10               Ckappa= 2.886
+Cf= 1.058e-10             Clc= 0.0000001              Cle= 0.6
+Dlc= 3E-08                Dwc= 0                      Vfbcv= -1
.OPTIONS ALLOW_AMBIGUOUS_MODELS
.backanno
.end